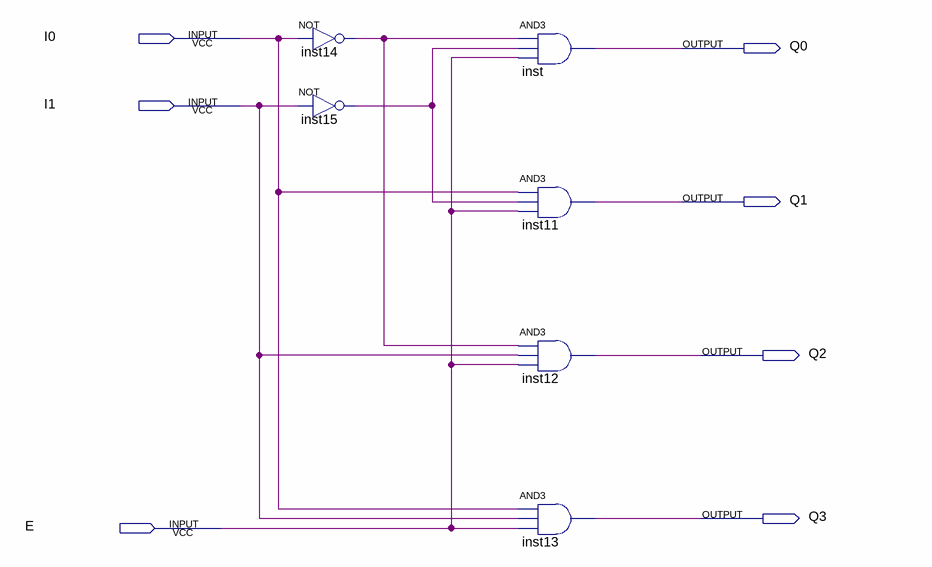
[diagram p0: schematic sheet]
// Quartus schematic de2_4.bdf as structural Verilog: 6 symbols, 7 pins
module de2_4 (
  input  I0,
  input  I1,
  input  E,
  output Q0,
  output Q1,
  output Q2,
  output Q3
);

  wire inst14_out, inst15_out;

  not inst14 (inst14_out, I0);
  not inst15 (inst15_out, I1);
  and inst (Q0, inst14_out, inst15_out, E);
  and inst11 (Q1, I0, inst15_out, E);
  and inst12 (Q2, inst14_out, I1, E);
  and inst13 (Q3, I0, I1, E);
endmodule
